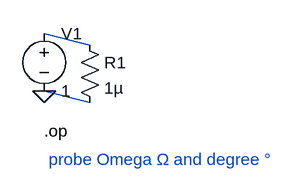
[diagram p0: schematic encoding_utf8.asc]
encoding_utf8.asc, the LTspice schematic file:
Version 4
SHEET 1 880 680
WIRE 160 64 96 48
WIRE 160 144 96 128
FLAG 96 128 0
SYMBOL voltage 96 32 R0
SYMATTR InstName V1
SYMATTR Value 1
SYMBOL res 144 48 R0
SYMATTR InstName R1
SYMATTR Value 1µ
TEXT 96 184 Left 2 !.op
TEXT 96 224 Left 2; probe Omega Ω and degree °

The netlist it stands for:
* encoding_utf8.asc
V1 N001 0 1
R1 N001 0 1µ
.op
*  probe Omega Ω and degree °
.backanno
.end